# Altium schematic sheet Switching-Regulators.SchDoc
size A4; SheetNumber: 4; SheetTotal: 9
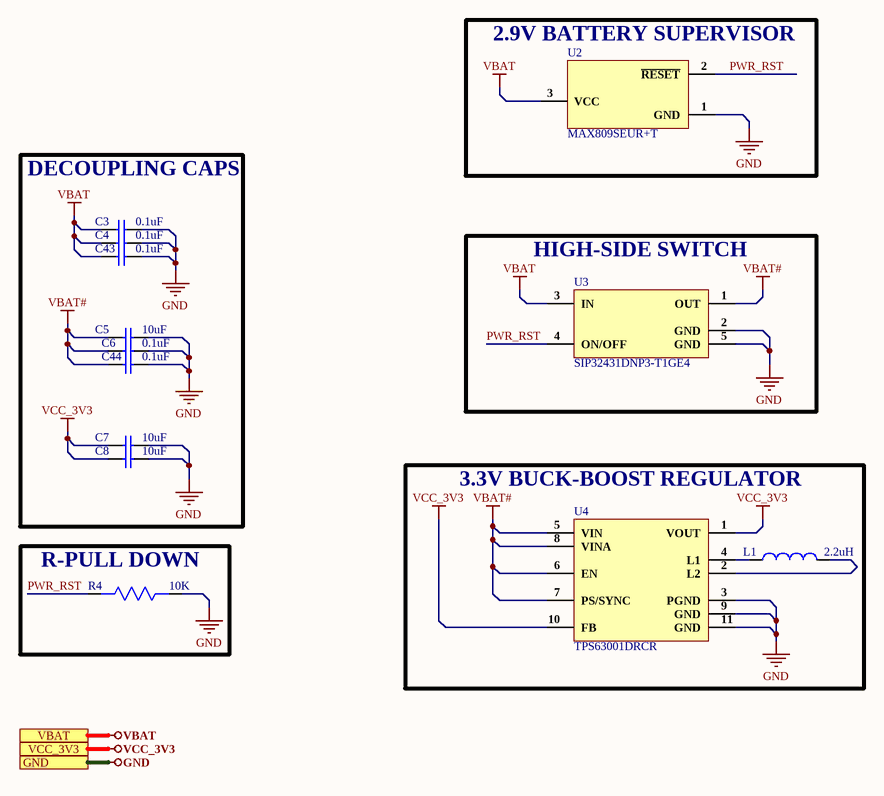
[diagram p0: Switching-Regulators.SchDoc]

## Parts
C3  0.1uF  [Cap 0402]
C4  0.1uF  [Cap 0402]
C5  10uF  [Cap0603]
C6  0.1uF  [Cap 0402]
C7  10uF  [Cap0603]
C8  10uF  [Cap0603]
C43  0.1uF  [Cap 0402]
C44  0.1uF  [Cap 0402]
L1  2.2uH  [MAKK2016T2R2M]
R4  10K  [Res0402]
U2  MAX809SEUR+T  [SOT-23]
U3  SIP32431DNP3-T1GE4  [4-TDFN (1.2x1.6)]
U4  TPS63001DRCR  [10-VSON (3x3)]

## Blocks framed on the sheet
2.9V BATTERY SUPERVISOR: U2
DECOUPLING CAPS: C3-C8 C43 C44
HIGH-SIDE SWITCH: U3
3.3V BUCK-BOOST REGULATOR: L1 U4
R-PULL DOWN: R4

## Ports
GND, VBAT, VCC_3V3

## Nets
GND: C3.2 C4.2 C5.2 C6.2 C7.2 C8.2 C43.2 C44.2 R4.1 U2.1(GND) U3.2(GND) U3.5(GND) U4.3(PGND) U4.9(GND) U4.11(GND) ; port GND
VBAT: C3.1 C4.1 C43.1 U2.3(VCC) U3.3(IN) ; port VBAT
VBAT#: C5.1 C6.1 C44.1 U3.1(OUT) U4.5(VIN) U4.6(EN) U4.7(PS/SYNC) U4.8(VINA)
VCC_3V3: C7.1 C8.1 U4.1(VOUT) U4.10(FB) ; port VCC_3V3
PWR_RST: R4.2 U2.2(~{RESET}) U3.4(ON/OFF)
NetL1_1: L1.1 U4.4(L1)
NetL1_2: L1.2 U4.2(L2)

## Notes on the sheet
- 1
- Huzaifa Ali

## Library data of the parts
C3 C4 C6 C43 C44 = GRM155R71H104ME14D: CAP CER 0.1UF 50V X7R 0402; Manufacturer: Murata; Tolerance: 20%; Capacitance: 100nF; Supplier 1: Digi-Key; Manufacturer Part Number: GRM155R71H104ME14D; Stock 1: 439844; Pricing 1: 1=0.1, 10=0.038, 100=0.0168, 500=0.01198, 1000=0.00941, 2500=0.00855, 5000=0.00787 (USD); Mount: Surface Mount; Case/Package: 0402; Min Operating Temperature: -55°C; Max Operating Temperature: 125°C; Packaging: Cut Tape; Voltage Rating: 50V; Length: 0.039inch; Width: 0.02inch; Thickness: 0.022inch; ComponentLink1URL: http://search.murata.co.jp/Ceramy/image/img/A01X/G101/ENG/GRM155R71H104ME14-01.pdf?src-supplier=Digi-Key; ComponentLink1Description: http://search.murata.co.jp/Ceramy/image/img/A01X/G101/ENG/GRM155R71H104ME14-01.pdf?src-supplier=Digi-Key; ComponentLink2URL: http://psearch.en.murata.com/capacitor/product/GRM155R71H104ME14%23.pdf?src-supplier=Avnet; ComponentLink2Description: http://psearch.en.murata.com/capacitor/product/GRM155R71H104ME14%23.pdf?src-supplier=Avnet; ComponentLink3URL: http://components.arrow.com/part/dataview/0323_07177683?src-supplier=Arrow+Europe; ComponentLink3Description: http://components.arrow.com/part/dataview/0323_07177683?src-supplier=Arrow+Europe; ComponentLink4URL: http://www.mouser.com/ds/2/281/c02e-2905.pdf?src-supplier=Mouser; ComponentLink4Description: http://www.mouser.com/ds/2/281/c02e-2905.pdf?src-supplier=Mouser; Supplier Part Number 1: 490-10701-1-ND
C5 C7 C8 = CL10A106MA8NRNC: CAP CER 10UF 25V X5R 0603; Manufacturer: Samsung; Tolerance: 20%; Supplier 1: Avnet; Manufacturer Part Number: CL10A106MA8NRNC; RoHS: Yes; Category: Ceramic Capacitors; Pricing 1: 4000=0.03753, 8000=0.03700, 16000=0.03595, 24000=0.03515, 32000=0.03383, 40000=0.03304, 400000=0.03225 (USD); Mount: Surface Mount; Case/Package: 0603; Case Code (Metric): 1608; Case Code (Imperial): 0603; Contact Plating: Tin; Min Operating Temperature: -55°C; Max Operating Temperature: 85°C; Package Quantity: 1; Packaging: Tape and Reel; Capacitance: 10uF; Voltage Rating: 25V; Dielectric: X5R; Termination: Wraparound; Series: CL; Construction: Flat; Length: 0.063inch; Width: 0.031inch; Thickness: 0.035inch; Lead Free: Lead Free; RoHS Compliant: Yes; ComponentLink1URL: https://datasheet.ciiva.com/25766/cl10a106ma8nrnc-25766562.pdf?src-supplier=Digi-Key; ComponentLink1Description: https://datasheet.ciiva.com/25766/cl10a106ma8nrnc-25766562.pdf?src-supplier=Digi-Key; Supplier Part Number 1: CL10A106MA8NRNC
L1 = MAKK2016T2R2M: FIXED IND 2.2UH 1.5A 160MOHM SMD; Manufacturer: Taiyo Yuden; Core Material: Metal; Tolerance: 20%; Shielding: Shielded; DC Resistance (DCR): 160mR; Test Frequency: 2MHz; Supplier 1: Mouser; Manufacturer Part Number: MAKK2016T2R2M; RoHS: Yes; Category: Fixed Inductors; Stock 1: 64320; Pricing 1: 1=0.27000, 10=0.17200, 50=0.17200, 100=0.14000, 1000=0.10600, 10000=0.09200 (USD); Mount: Surface Mount; Case/Package: 0806; Case Code (Metric): 2016; Case Code (Imperial): 0806; Min Operating Temperature: -40°C; Max Operating Temperature: 105°C; Packaging: Tape and Reel; Package Quantity: 3000; Resistor Type: Wirewound; Inductance: 2.2uH; Current Rating: 1.5A; Saturation Current: 1.5A; Max DC Current: 1.5A; Termination: SMD/SMT; Length: 0.079inch; Width: 0.063inch; Height: 1mm; Height - Seated (Max): 0.039inch; Depth: 1.6mm; Radiation Hardening: No; Halogen Free: Halogen Free; RoHS Compliant: Yes; ComponentLink1URL: https://datasheet.ciiva.com/30014/makk2016t2r2m-ss-30014449.pdf?src-supplier=Avnet; ComponentLink1Description: https://datasheet.ciiva.com/30014/makk2016t2r2m-ss-30014449.pdf?src-supplier=Avnet; Supplier Part Number 1: 963-MAKK2016T2R2M
R4 = RC0402FR-0710KL: RES SMD 10K OHM 1% 1/16W 0402; Manufacturer: Yageo; Resistance: 10kR; Temperature Coefficient: 100ppm/°C; Voltage Rating (DC): 50V; Power Rating: 62.5mW; Supplier 1: Digi-Key; Manufacturer Part Number: RC0402FR-0710KL; Stock 1: 60122563; Pricing 1: 1=0.1, 10=0.016, 100=0.0064, 1000=0.00289, 2500=0.00251, 5000=0.00207 (USD); Case/Package: 0402; Number of Pins: 2; Case Code (Imperial): 0402; Case Code (Metric): 1005; Min Operating Temperature: -55°C; Max Operating Temperature: 155°C; Composition: Thick Film; Tolerance: 1%; Packaging: Tape and Reel; Voltage Rating: 50V; Termination: SMD/SMT; Military Standard: Not; Working Voltage: 50V; Number of Terminations: 2; Length: 1mm; Height: 0.32mm; Width: 0.5mm; Depth: 0.5mm; Lead Pitch: 0.2mm; REACH SVHC: No SVHC; Lead Free: Lead Free; ComponentLink1URL: http://www.farnell.com/datasheets/2167052.pdf?src-supplier=Element14; ComponentLink1Description: http://www.farnell.com/datasheets/2167052.pdf?src-supplier=Element14; ComponentLink2URL: http://www.farnell.com/datasheets/1686128.pdf?src-supplier=Element14; ComponentLink2Description: http://www.farnell.com/datasheets/1686128.pdf?src-supplier=Element14; ComponentLink3URL: http://www.farnell.com/datasheets/1784430.pdf?src-supplier=Element14; ComponentLink3Description: http://www.farnell.com/datasheets/1784430.pdf?src-supplier=Element14; ComponentLink4URL: http://www.yageo.com/documents/recent/PYu-RC_Group_51_RoHS_L_9.pdf?src-supplier=Mouser; ComponentLink4Description: http://www.yageo.com/documents/recent/PYu-RC_Group_51_RoHS_L_9.pdf?src-supplier=Mouser; Supplier Part Number 1: 311-10.0KLRDKR-ND
U2 = MAX809SEUR+T: IC MPU/RESET CIRC SOT23-3; Manufacturer: Maxim; Min Supply Voltage: 1.2V; Max Supply Voltage: 5.5V; Max Power Dissipation: 320mW; Number of Voltages Monitored: 1; Reset: Active Low; Reset Timeout: 140ms; Threshold Voltage: 2.93V; Watchdog Timer: No; Min Reset Threshold Voltage: 2.89V; Max Reset Threshold Voltage: 2.96V; Output: TOTEM-POLE; Operating Supply Current: 60uA; Max Output Current: 20mA; Nominal Supply Current: 17uA; Output Type: PUSH-PULL; Supplier 1: Mouser; Manufacturer Part Number: MAX809SEUR+T; RoHS: Yes; Category: Voltage Supervisors; Stock 1: 26180; Pricing 1: 1=3.68000, 10=3.31000, 25=3.13000, 50=3.13000, 100=2.72000, 250=2.58000, 500=2.31000, 1000=2.09000, 10000=2.01000 (USD); Mount: Surface Mount; Case/Package: SOT-23; Number of Pins: 3; Min Operating Temperature: -40°C; Max Operating Temperature: 105°C; Type: Simple Reset/Power-On Reset; Packaging: Cut Tape; Package Quantity: 1; Series: -; Overvoltage Threshold: 2.96V; Undervoltage Threshold: 2.89V; Termination: SMD/SMT; Power Dissipation: 320mW; Length: 2.92mm; Width: 1.3mm; Height: 0.94mm; Radiation Hardening: No; Lead Free: Lead Free; RoHS Compliant: Yes; REACH SVHC: No SVHC; ComponentLink1URL: https://datasheet.ciiva.com/1169/max803-max810z-1169879.pdf?src-supplier=Element14; ComponentLink1Description: https://datasheet.ciiva.com/1169/max803-max810z-1169879.pdf?src-supplier=Element14; ComponentLink2URL: https://datasheet.ciiva.com/1169/max803-max810z-1169878.pdf?src-supplier=Element14; ComponentLink2Description: https://datasheet.ciiva.com/1169/max803-max810z-1169878.pdf?src-supplier=Element14; ComponentLink3URL: https://datasheet.ciiva.com/14226/max803-max810z-14226330.pdf?src-supplier=Avnet; ComponentLink3Description: https://datasheet.ciiva.com/14226/max803-max810z-14226330.pdf?src-supplier=Avnet; ComponentLink4URL: https://datasheet.ciiva.com/1973/max803-max810z-1973322.pdf?src-supplier=Digi-Key; ComponentLink4Description: https://datasheet.ciiva.com/1973/max803-max810z-1973322.pdf?src-supplier=Digi-Key; ComponentLink5URL: https://datasheet.ciiva.com/1973/max803-max810z-1973323.pdf?src-supplier=Digi-Key; ComponentLink5Description: https://datasheet.ciiva.com/1973/max803-max810z-1973323.pdf?src-supplier=Digi-Key; ComponentLink6URL: https://datasheet.ciiva.com/1973/max803-max810z-1973321.pdf?src-supplier=Digi-Key; ComponentLink6Description: https://datasheet.ciiva.com/1973/max803-max810z-1973321.pdf?src-supplier=Digi-Key; Supplier Part Number 1: 700-MAX809SEURT
U3 = SIP32431DNP3-T1GE4: IC SWITCH HIGH SIDE 4TDFN; Manufacturer: Vishay Siliconix; Output Current: 1A; Number of Outputs: 1; Max Power Dissipation: 324mW; Max Supply Voltage: 5.5V; Min Supply Voltage: 1.1V; Interface: On/Off; Max Output Current: 1.4A; On-State Resistance: 520mR; Turn-Off Delay Time: 10us; Turn-On Delay Time: 40us; Fault Protection: Reverse Current; Supplier 1: Arrow Electronics; Manufacturer Part Number: SIP32431DNP3-T1GE4; RoHS: Yes; Category: Hot Swap Controllers; Stock 1: 2913; Pricing 1: 1=0.66250, 10=0.57780, 25=0.57210, 100=0.43730, 250=0.41140, 500=0.34220, 1000=0.27210, 3000=0.25500 (USD); Mount: Surface Mount; Number of Pins: 4; Weight: 0.001764oz; Min Operating Temperature: -40°C; Max Operating Temperature: 85°C; Packaging: Tape and Reel; Package Quantity: 3000; Power Dissipation: 324mW; Output Configuration: High Side; Series: SIP324x1; Radiation Hardening: No; Lead Free: Lead Free; RoHS Compliant: Yes; ComponentLink1URL: https://datasheet.ciiva.com/15109/getdatasheetpartid-704627-15109219.pdf?src-supplier=Verical; ComponentLink1Description: https://datasheet.ciiva.com/15109/getdatasheetpartid-704627-15109219.pdf?src-supplier=Verical; ComponentLink2URL: https://datasheet.ciiva.com/1954/sip32431-1954885.pdf?src-supplier=Digi-Key; ComponentLink2Description: https://datasheet.ciiva.com/1954/sip32431-1954885.pdf?src-supplier=Digi-Key; Supplier Part Number 1: SIP32431DNP3-T1GE4
U4 = TPS63001DRCR: IC REG BUCK BST 3.3V 1.6A 10SON; Manufacturer: Texas Instruments; Switching Frequency: 1.5MHz; Efficiency: 96%; Number of Outputs: 1; Output Current: 1.2A; Max Input Voltage: 5.5V; Min Input Voltage: 1.8V; Synchronous Rectifier: Yes; Quiescent Current: 30uA; Output Type: Fixed; Topology: Buck-Boost; Supplier 1: Mouser; Manufacturer Part Number: TPS63001DRCR; RoHS: Yes; Category: Voltage Regulators - Switching; Pricing 1: 1=2.67000, 10=2.41000, 50=2.27000, 100=1.94000, 1000=1.32000, 10000=1.32000 (USD); Number of Pins: 10; Weight: 0.000921oz; Contact Plating: Gold; Min Operating Temperature: -40°C; Max Operating Temperature: 85°C; Packaging: Tape and Reel; Output Voltage: 3.3V; Package Quantity: 1; Max Output Current: 1.2A; Min Output Voltage: 3.3V; Max Output Voltage: 3.3V; Operating Supply Voltage: 5.5V; Nominal Output Voltage: 3.3V; Radiation Hardening: No; Lead Free: Lead Free; RoHS Compliant: Yes; REACH SVHC: No SVHC; ComponentLink1URL: https://datasheet.ciiva.com/2025/tps63001-2025809.pdf?src-supplier=Digi-Key; ComponentLink1Description: https://datasheet.ciiva.com/2025/tps63001-2025809.pdf?src-supplier=Digi-Key; ComponentLink2URL: https://datasheet.ciiva.com/3220/slvs520b-3220364.pdf?src-supplier=Avnet; ComponentLink2Description: https://datasheet.ciiva.com/3220/slvs520b-3220364.pdf?src-supplier=Avnet; ComponentLink3URL: https://datasheet.ciiva.com/15113/getdatasheetpartid-188339-15113751.pdf?src-supplier=Verical; ComponentLink3Description: https://datasheet.ciiva.com/15113/getdatasheetpartid-188339-15113751.pdf?src-supplier=Verical; ComponentLink4URL: https://datasheet.ciiva.com/41462/001014938-da-01-en-ic-reg-buck-bst-tps63001drcr-vson-10-tid-41462783.pdf?src-supplier=Conrad; ComponentLink4Description: https://datasheet.ciiva.com/41462/001014938-da-01-en-ic-reg-buck-bst-tps63001drcr-vson-10-tid-41462783.pdf?src-supplier=Conrad; ComponentLink5URL: https://datasheet.ciiva.com/7994/1831174-7994044.pdf?src-supplier=Element14; ComponentLink5Description: https://datasheet.ciiva.com/7994/1831174-7994044.pdf?src-supplier=Element14; ComponentLink6URL: https://datasheet.ciiva.com/46394/1854797-46394566.pdf?src-supplier=Element14; ComponentLink6Description: https://datasheet.ciiva.com/46394/1854797-46394566.pdf?src-supplier=Element14; ComponentLink7URL: https://datasheet.ciiva.com/2025/tps63001-2025813.pdf?src-supplier=Digi-Key; ComponentLink7Description: https://datasheet.ciiva.com/2025/tps63001-2025813.pdf?src-supplier=Digi-Key; ComponentLink8URL: https://datasheet.ciiva.com/2025/tps63001-2025812.pdf?src-supplier=Digi-Key; ComponentLink8Description: https://datasheet.ciiva.com/2025/tps63001-2025812.pdf?src-supplier=Digi-Key; ComponentLink9URL: https://datasheet.ciiva.com/3220/tps63001-3220363.pdf?src-supplier=Avnet; ComponentLink9Description: https://datasheet.ciiva.com/3220/tps63001-3220363.pdf?src-supplier=Avnet; Supplier Part Number 1: 595-TPS63001DRCR